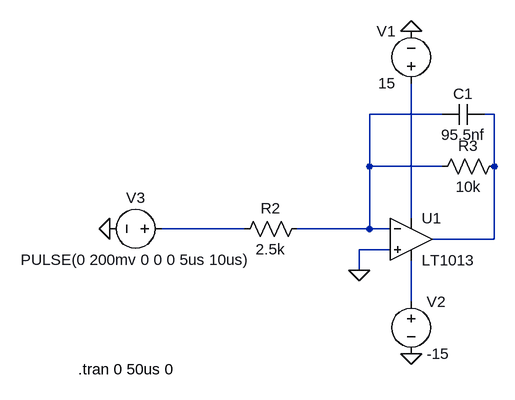
[diagram p0: schematic exp4.asc]
exp4.asc, the LTspice schematic file:
Version 4.1
SHEET 1 880 680
WIRE 240 -32 128 -32
WIRE 320 -32 304 -32
WIRE 128 48 128 -32
WIRE 240 48 128 48
WIRE 320 48 320 -32
WIRE 192 128 192 -80
WIRE -64 144 -192 144
WIRE 128 144 128 48
WIRE 128 144 16 144
WIRE 160 144 128 144
WIRE 320 160 320 48
WIRE 320 160 224 160
WIRE 160 176 112 176
WIRE 112 208 112 176
WIRE 192 256 192 192
FLAG 192 -160 0
FLAG 192 336 0
FLAG -272 144 0
FLAG 112 208 0
SYMBOL OpAmps\\LT1013 192 96 R0
SYMATTR InstName U1
SYMBOL res 32 128 R90
WINDOW 0 0 56 VBottom 2
WINDOW 3 32 56 VTop 2
SYMATTR InstName R2
SYMATTR Value 2.5k
SYMBOL res 336 32 R90
WINDOW 0 0 56 VBottom 2
WINDOW 3 32 56 VTop 2
SYMATTR InstName R3
SYMATTR Value 10k
SYMBOL voltage 192 -64 R180
WINDOW 0 24 96 Left 2
WINDOW 3 24 16 Left 2
WINDOW 123 0 0 Left 0
WINDOW 39 0 0 Left 0
SYMATTR InstName V1
SYMATTR Value 15
SYMBOL voltage 192 240 R0
WINDOW 123 0 0 Left 0
WINDOW 39 0 0 Left 0
SYMATTR InstName V2
SYMATTR Value -15
SYMBOL voltage -176 144 R90
WINDOW 0 -32 56 VBottom 2
WINDOW 3 32 56 VTop 2
WINDOW 123 0 0 Left 0
WINDOW 39 0 0 Left 0
SYMATTR InstName V3
SYMATTR Value PULSE(0 200mv 0 0 0 5us 10us)
SYMBOL cap 304 -48 R90
WINDOW 0 0 32 VBottom 2
WINDOW 3 32 32 VTop 2
SYMATTR InstName C1
SYMATTR Value 95.5nf
TEXT -320 360 Left 2 !.tran 0 50us 0

The netlist it stands for:
* exp4.asc
X§U1 0 N001 N003 N005 N002 LT1013  ; pins In+ In- V+ V- OUT
R2 N001 N004 2.5k
R3 N002 N001 10k
V1 N003 0 15
V2 N005 0 -15
V3 N004 0 PULSE(0 200mv 0 0 0 5us 10us)
C1 N002 N001 95.5nf
.tran 0 50us 0
.lib LTC.lib
.backanno
.end